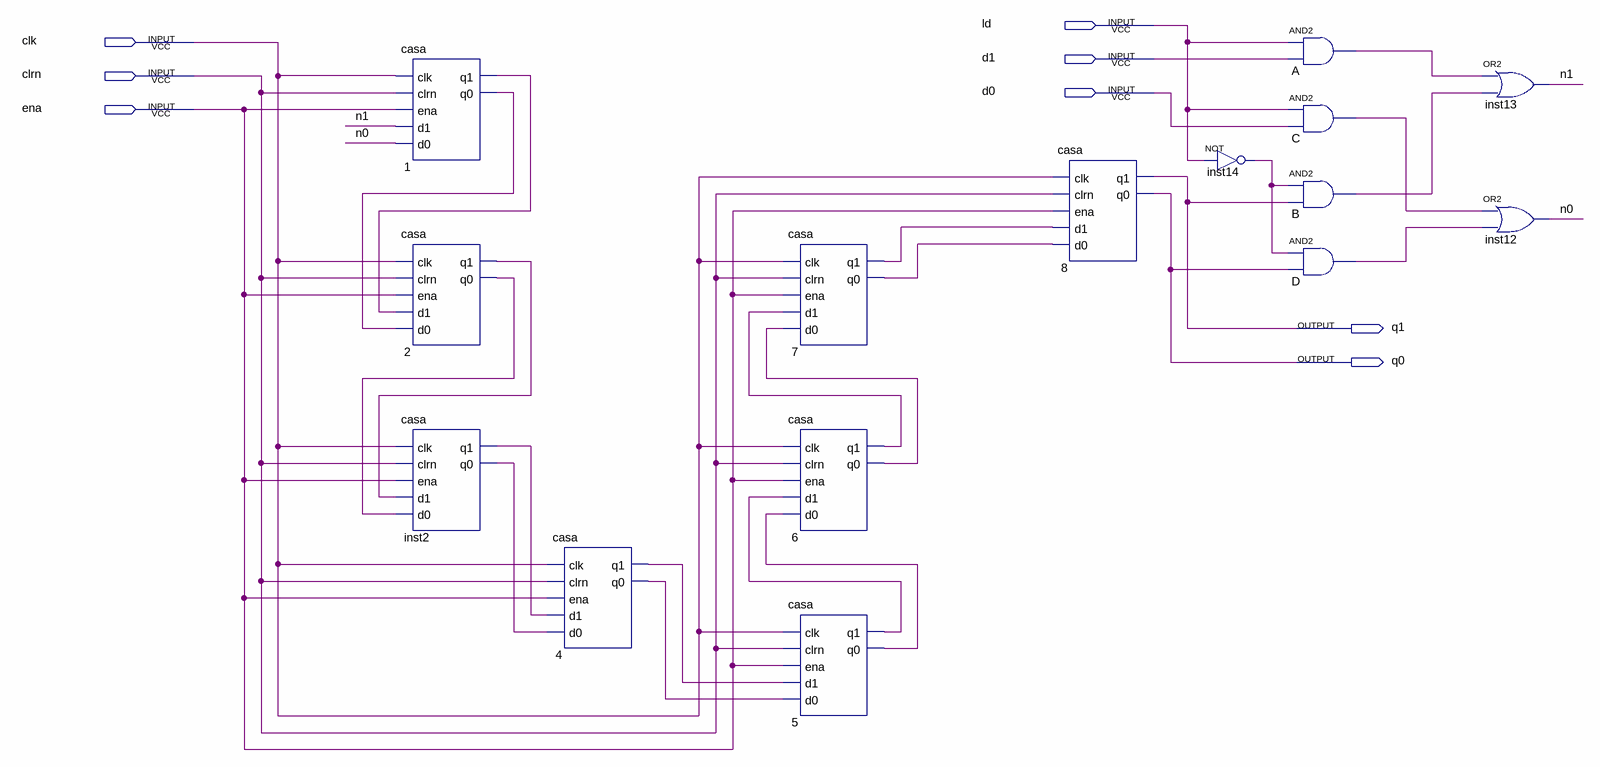
[diagram p0: schematic sheet]
// Quartus schematic desloc.bdf as structural Verilog: 15 symbols, 8 pins
module desloc (
  input  ld,
  input  clk,
  input  d1,
  input  clrn,
  input  d0,
  input  ena,
  output q1,
  output q0
);

  wire A_out, B_out, C_out, D_out, inst2_q0, inst2_q1, inst14_out, n0, n1, n1_q0, n1_q1, n2_q0, n2_q1, n4_q0,
       n4_q1, n5_q0, n5_q1, n6_q0, n6_q1, n7_q0, n7_q1;

  casa u_1 (.clk(clk), .clrn(clrn), .ena(ena), .d1(n1), .d0(n0), .q1(n1_q1), .q0(n1_q0));
  casa u_2 (.clk(clk), .clrn(clrn), .ena(ena), .d1(n1_q1), .d0(n1_q0), .q1(n2_q1), .q0(n2_q0));
  casa inst2 (.clk(clk), .clrn(clrn), .ena(ena), .d1(n2_q1), .d0(n2_q0), .q1(inst2_q1), .q0(inst2_q0));
  casa u_4 (.clk(clk), .clrn(clrn), .ena(ena), .d1(inst2_q1), .d0(inst2_q0), .q1(n4_q1), .q0(n4_q0));
  casa u_7 (.clk(clk), .clrn(clrn), .ena(ena), .d1(n6_q1), .d0(n6_q0), .q1(n7_q1), .q0(n7_q0));
  casa u_6 (.clk(clk), .clrn(clrn), .ena(ena), .d1(n5_q1), .d0(n5_q0), .q1(n6_q1), .q0(n6_q0));
  casa u_5 (.clk(clk), .clrn(clrn), .ena(ena), .d1(n4_q1), .d0(n4_q0), .q1(n5_q1), .q0(n5_q0));
  casa u_8 (.clk(clk), .clrn(clrn), .ena(ena), .d1(n7_q1), .d0(n7_q0), .q1(q1), .q0(q0));
  not inst14 (inst14_out, ld);
  and A (A_out, ld, d1);
  and C (C_out, ld, d0);
  and B (B_out, inst14_out, q1);
  and D (D_out, inst14_out, q0);
  or inst13 (n1, A_out, B_out);
  or inst12 (n0, C_out, D_out);
endmodule
